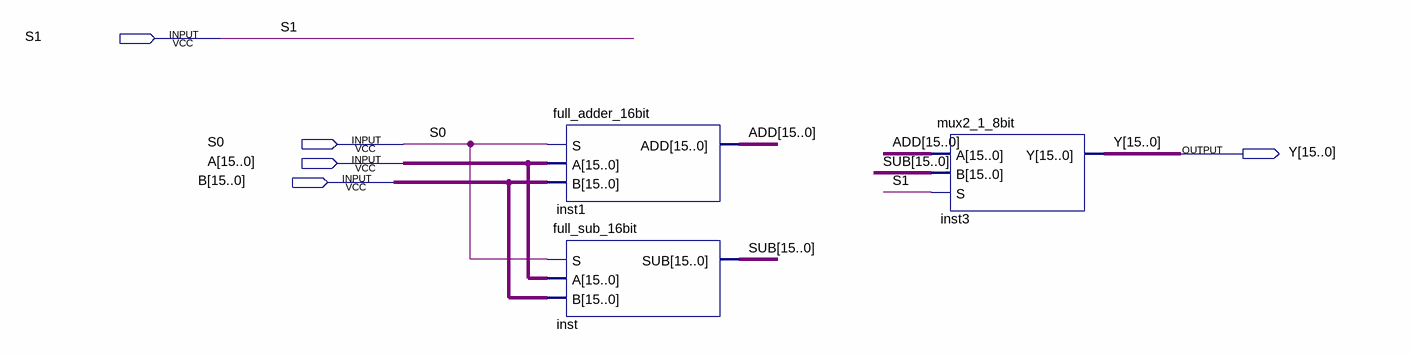
[diagram p0: schematic sheet]
// Quartus schematic AU.bdf as structural Verilog: 3 symbols, 5 pins
module AU (
  input  S1,
  input  S0,
  input  [15:0] A,
  input  [15:0] B,
  output [15:0] Y
);

  wire [15:0] ADD, SUB;

  full_adder_16bit inst1 (.S(S0), .A(A), .B(B), .ADD(ADD));
  full_sub_16bit inst (.S(S0), .A(A), .B(B), .SUB(SUB));
  mux2_1_8bit inst3 (.A(ADD), .B(SUB), .S(S1), .Y(Y));
endmodule
